# Altium schematic sheet Raspberry_PI5.SchDoc
size A4; SheetNumber: 1; SheetTotal: 9
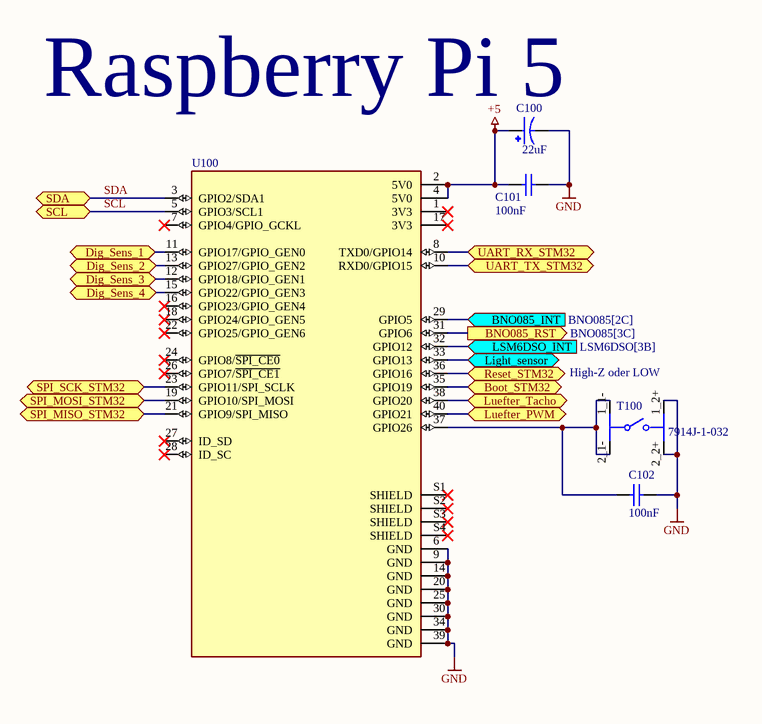
[diagram p0: Raspberry_PI5.SchDoc]

## Parts
C100  value 22uF  [CAP_EEEFN1A220R]  (hidden comment: ELKO)
C101  value 100nF  [0603]  (hidden comment: 0603)
C102  value 100nF  [0603]  (hidden comment: 0603)
T100  7914J-1-032  [FP-7914J-1-032-MFG]
U100  Raspberry Pi 5  [MODULE_SC0195(9)]  (value not drawn)

## Ports
BNO085_INT (in, see BNO085[2C]), BNO085_RST (out, see BNO085[3C]), Boot_STM32 (bidir, see STM32[2C]), Dig_Sens_1 (bidir, see Test_Sensor_Connectoren[1A]), Dig_Sens_2 (bidir, see Test_Sensor_Connectoren[1A]), Dig_Sens_3 (bidir, see Test_Sensor_Connectoren[1B]), Dig_Sens_4 (bidir, see Test_Sensor_Connectoren[1B]), Light_sensor (bidir, see Test_Sensor_Connectoren[1C]), LSM6DSO_INT (in, see LSM6DSO[3B]), Luefter_PWM (bidir, see Test_Sensor_Connectoren[2C]), Luefter_Tacho (bidir, see Test_Sensor_Connectoren[2C]), Reset_STM32 (bidir, see STM32[2C]), SCL (bidir, see BNO085[2C], LSM6DSO[2B], PCA9685[2B], Test_Sensor_Connectoren[1D], Test_Sensor_Connectoren[2D]), SDA (bidir, see BNO085[2C], LSM6DSO[2B], PCA9685[2B], Test_Sensor_Connectoren[1C], Test_Sensor_Connectoren[2D]), SPI_MISO_STM32 (bidir, see STM32[2B]), SPI_MOSI_STM32 (bidir, see STM32[2B]), SPI_SCK_STM32 (bidir, see STM32[1C]), UART_RX_STM32 (bidir, see STM32[1C]), UART_TX_STM32 (bidir, see STM32[1C])

## Nets
+5: C100.1 C101.2 U100.2(5V0) U100.4(5V0)
GND: C100.2 C101.1 C102.2 T100.1_2+(1_2+) T100.2_2+(2_2+) U100.6(GND) U100.9(GND) U100.14(GND) U100.20(GND) U100.25(GND) U100.30(GND) U100.34(GND) U100.39(GND)
BNO085_INT: U100.29(GPIO5) ; port BNO085_INT
BNO085_RST: U100.31(GPIO6) ; port BNO085_RST
Boot_STM32: U100.35(GPIO19) ; port Boot_STM32
Dig_Sens_1: U100.11(GPIO17/GPIO_GEN0) ; port Dig_Sens_1
Dig_Sens_2: U100.13(GPIO27/GPIO_GEN2) ; port Dig_Sens_2
Dig_Sens_3: U100.12(GPIO18/GPIO_GEN1) ; port Dig_Sens_3
Dig_Sens_4: U100.15(GPIO22/GPIO_GEN3) ; port Dig_Sens_4
Light_sensor: U100.33(GPIO13) ; port Light_sensor
LSM6DSO_INT: U100.32(GPIO12) ; port LSM6DSO_INT
Luefter_PWM: U100.40(GPIO21) ; port Luefter_PWM
Luefter_Tacho: U100.38(GPIO20) ; port Luefter_Tacho
Reset_STM32: U100.36(GPIO16) ; port Reset_STM32
SCL: U100.5(GPIO3/SCL1) ; port SCL
SDA: U100.3(GPIO2/SDA1) ; port SDA
SPI_MISO_STM32: U100.21(GPIO9/SPI_MISO) ; port SPI_MISO_STM32
SPI_MOSI_STM32: U100.19(GPIO10/SPI_MOSI) ; port SPI_MOSI_STM32
SPI_SCK_STM32: U100.23(GPIO11/SPI_SCLK) ; port SPI_SCK_STM32
UART_RX_STM32: U100.8(TXD0/GPIO14) ; port UART_RX_STM32
UART_TX_STM32: U100.10(RXD0/GPIO15) ; port UART_TX_STM32
NetC102_1: C102.1 T100.1_1-(1_1-) T100.2_1-(2_1-) U100.37(GPIO26)

Not connected (* = marked no-connect by the designer): U100 1(3V3)* 7(GPIO4/GPIO_GCKL)* 16(GPIO23/GPIO_GEN4)* 17(3V3)* 18(GPIO24/GPIO_GEN5)* 22(GPIO25/GPIO_GEN6)* 24(GPIO8/~{SPI_CE0})* 26(GPIO7/~{SPI_CE1})* 27(ID_SD)* 28(ID_SC)* S1(SHIELD)* S2(SHIELD)* S3(SHIELD)* S4(SHIELD)*

## Notes on the sheet
- (near C100) Raspberry Pi 5
- (near T100) High-Z oder LOW

## Library data of the parts
C100 = EEEFN1A220R: CAP ALUM 22UF 20% 10V SMD; MF: Panasonic; SnapEDA_Link: https://www.snapeda.com/parts/EEEFN1A220R/Panasonic/view-part/?ref=snap; Availability: In Stock; Purchase-URL: https://pricing.snapeda.com/search/part/EEEFN1A220R/?ref=eda; MP: EEEFN1A220R; Price: None; Package: RADIAL-2 Panasonic; Check_prices: https://www.snapeda.com/parts/EEEFN1A220R/Panasonic/view-part/?ref=eda
C101 C102 = KO: Kondensator
T100 = CMP-07427-000007-1: SWITCH TACTILE SPST-NO 0.1A 16V; Mechanical Life: 100000Cycles; Switch Function: Off-Mom; Actuator Material: Rubber; Illumination Type: Non-Illuminated; Actuator Type: Standard; Operating Force: 300gf; Throw Configuration: SPST; Current Rating: 100mA; Contact Plating: Silver; Min Operating Temperature: -55°C; Series: 7914; Package Quantity: 50; Max Operating Temperature: 125°C; Depth: 5mm; Termination: J-Hook; Mount: Surface Mount; RoHS Compliant: Yes; Case/Package: SMD/SMT; Voltage Rating (DC): 16V; Orientation: Straight; Max Current Rating: 100mA; Packaging: Rail/Tube; Length: 5mm; Contact Material: Gold
U100 = SC0195(9): The Raspberry Pi 5 Model B; SnapEDA_Link: https://www.snapeda.com/parts/SC0195(9)/Raspberry+Pi/view-part/?ref=snap; Package: None; Value: *; MF: Raspberry Pi; MP: SC0195(9); Check_prices: https://www.snapeda.com/parts/SC0195(9)/Raspberry+Pi/view-part/?ref=eda